# Altium schematic sheet LED_Central.SchDoc
size A; SheetNumber: 1; SheetTotal: 1
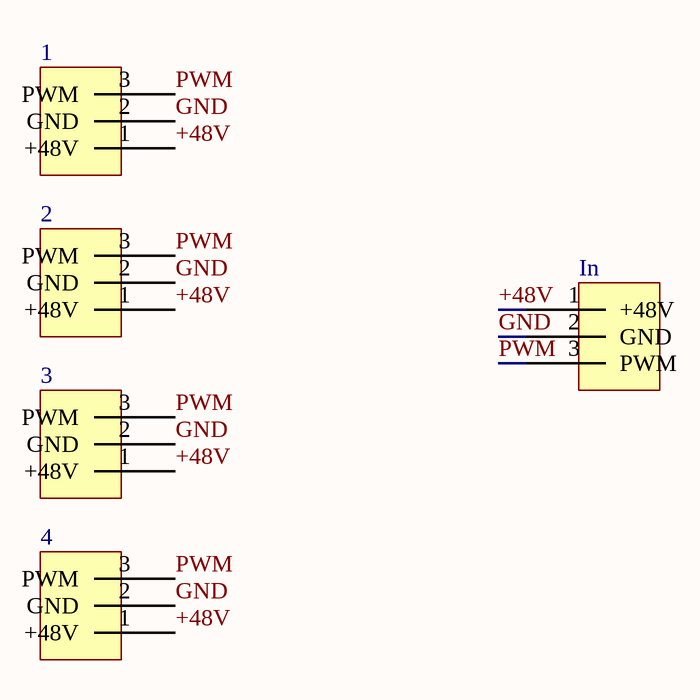
[diagram p0: LED_Central.SchDoc]

## Parts
1  WIRE_OUTPUT  [PCBComponent_1]  (value not drawn)
2  WIRE_OUTPUT  [PCBComponent_1]  (value not drawn)
3  WIRE_OUTPUT  [PCBComponent_1]  (value not drawn)
4  WIRE_OUTPUT  [PCBComponent_1]  (value not drawn)
In  WIRE_INPUT  [PCBComponent_1]  (value not drawn)

## Nets
+48V: 1.1(+48V) 2.1(+48V) 3.1(+48V) 4.1(+48V) In.1(+48V)
GND: 1.2(GND) 2.2(GND) 3.2(GND) 4.2(GND) In.2(GND)
PWM: 1.3(PWM) 2.3(PWM) 3.3(PWM) 4.3(PWM) In.3(PWM)

## Library data of the parts
In = WIRE_OUTPUT